# Altium schematic sheet Top Sheet.SchDoc
size A4; DocumentNumber: 1; SheetNumber: 1; SheetTotal: 9
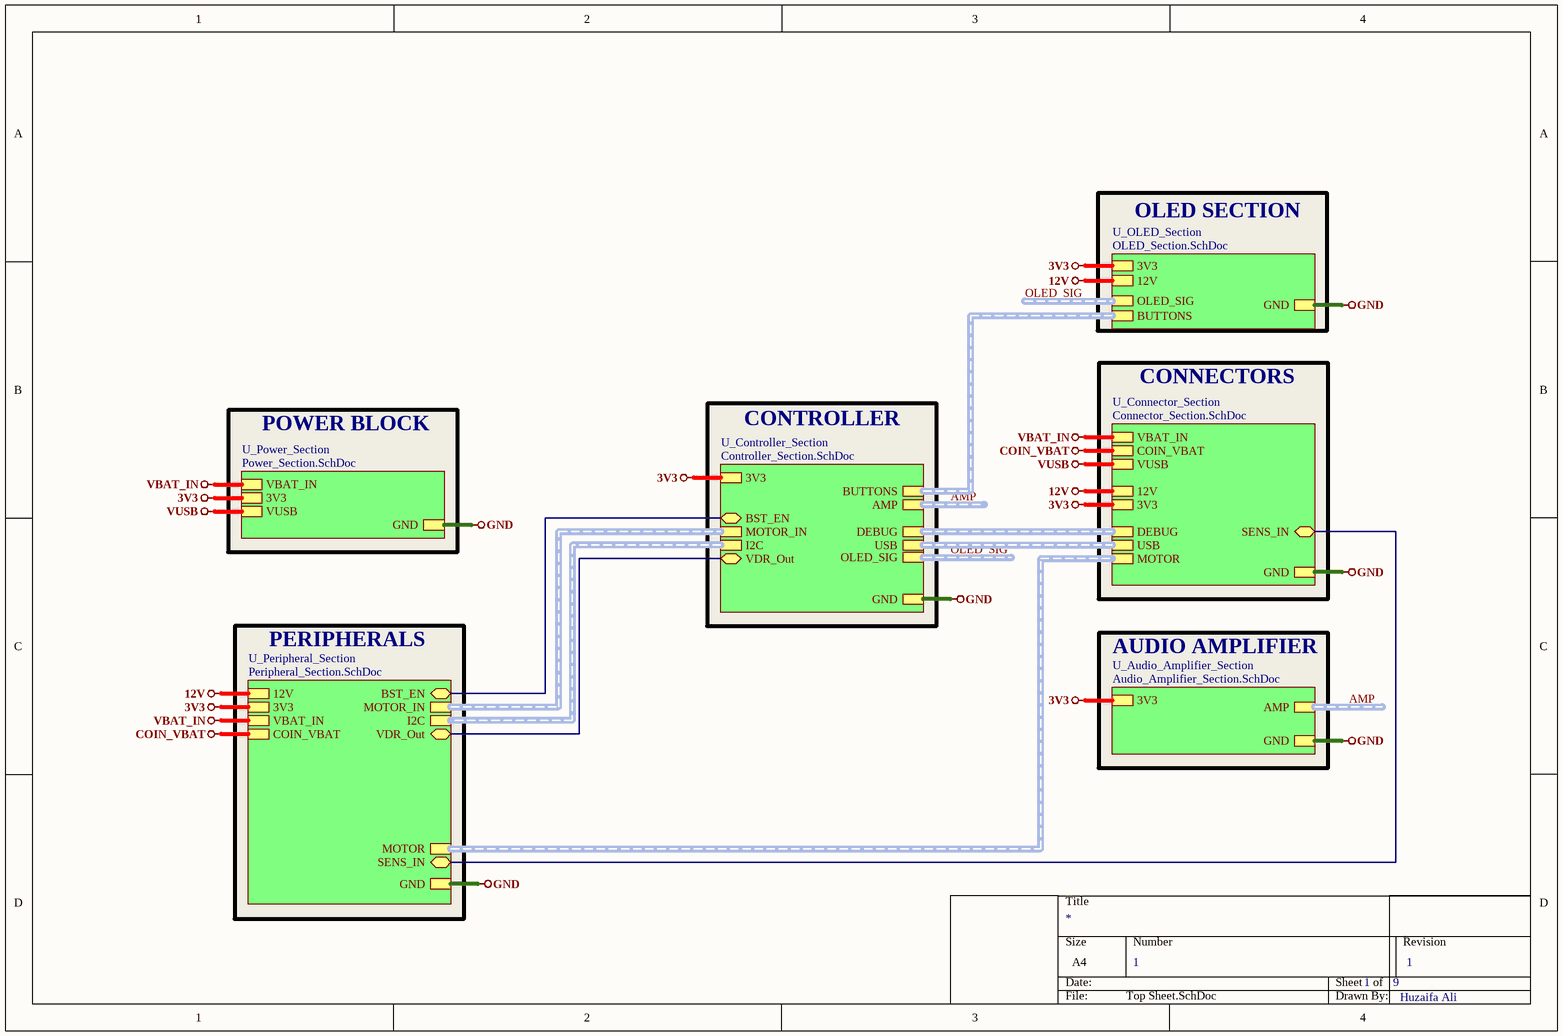
[diagram p0: Top Sheet.SchDoc]

## Sub-sheets
U_Audio_Amplifier_Section = Audio_Amplifier_Section.SchDoc: 3V3, GND, AMP (harness AMP)
U_Connector_Section = Connector_Section.SchDoc: SENS_IN (bidir), DEBUG (harness DEBUG), USB (harness USB), MOTOR (harness MOTOR), 12V, 3V3, GND, VBAT_IN, COIN_VBAT, VUSB
U_Controller_Section = Controller_Section.SchDoc: VDR_Out (bidir), USB (harness USB), DEBUG (harness DEBUG), I2C (harness I2C), MOTOR_IN (harness MOTOR_IN), 3V3, GND, BST_EN (bidir), AMP (harness AMP), OLED_SIG (harness OLED_SIG), BUTTONS (harness BUTTONS)
U_OLED_Section = OLED_Section.SchDoc: OLED_SIG (harness OLED_SIG), 12V, 3V3, GND, BUTTONS (harness BUTTONS)
U_Peripheral_Section = Peripheral_Section.SchDoc: BST_EN (bidir), SENS_IN (bidir), VDR_Out (bidir), MOTOR (harness MOTOR), I2C (harness I2C), MOTOR_IN (harness MOTOR_IN), 12V, 3V3, GND, VBAT_IN, COIN_VBAT
U_Power_Section = Power_Section.SchDoc: VBAT_IN, 3V3, GND, VUSB

## Nets
3V3: sheet U_Power_Section/3V3, sheet U_Peripheral_Section/3V3, sheet U_Controller_Section/3V3, sheet U_Connector_Section/3V3, sheet U_Audio_Amplifier_Section/3V3, sheet U_OLED_Section/3V3
12V: sheet U_Peripheral_Section/12V, sheet U_Connector_Section/12V, sheet U_OLED_Section/12V
COIN_VBAT: sheet U_Peripheral_Section/COIN_VBAT, sheet U_Connector_Section/COIN_VBAT
GND: sheet U_Power_Section/GND, sheet U_Peripheral_Section/GND, sheet U_Controller_Section/GND, sheet U_Connector_Section/GND, sheet U_Audio_Amplifier_Section/GND, sheet U_OLED_Section/GND
VBAT_IN: sheet U_Power_Section/VBAT_IN, sheet U_Peripheral_Section/VBAT_IN, sheet U_Connector_Section/VBAT_IN
VUSB: sheet U_Power_Section/VUSB, sheet U_Connector_Section/VUSB
(unnamed): sheet U_Peripheral_Section/BST_EN, sheet U_Controller_Section/BST_EN
(unnamed): sheet U_Peripheral_Section/SENS_IN, sheet U_Connector_Section/SENS_IN
(unnamed): sheet U_Peripheral_Section/VDR_Out, sheet U_Controller_Section/VDR_Out

## Buses and harness runs
harness AMP = sheet U_Audio_Amplifier_Section/AMP
harness AMP = sheet U_Controller_Section/AMP
harness OLED_SIG = sheet U_Controller_Section/OLED_SIG
harness OLED_SIG = sheet U_OLED_Section/OLED_SIG
harness sheet U_Connector_Section/DEBUG = sheet U_Controller_Section/DEBUG
harness sheet U_Connector_Section/MOTOR = sheet U_Peripheral_Section/MOTOR
harness sheet U_Connector_Section/USB = sheet U_Controller_Section/USB
harness sheet U_Controller_Section/BUTTONS = sheet U_OLED_Section/BUTTONS
harness sheet U_Controller_Section/I2C = sheet U_Peripheral_Section/I2C
harness sheet U_Controller_Section/MOTOR_IN = sheet U_Peripheral_Section/MOTOR_IN

## Notes on the sheet
- OLED SECTION
- CONNECTORS
- POWER BLOCK
- CONTROLLER
- PERIPHERALS
- AUDIO AMPLIFIER
- 1
- Huzaifa Ali